# Altium schematic sheet RV1126_OSC-PLL-PMUIO.SchDoc
size A4; SheetNumber: 16; SheetTotal: 28
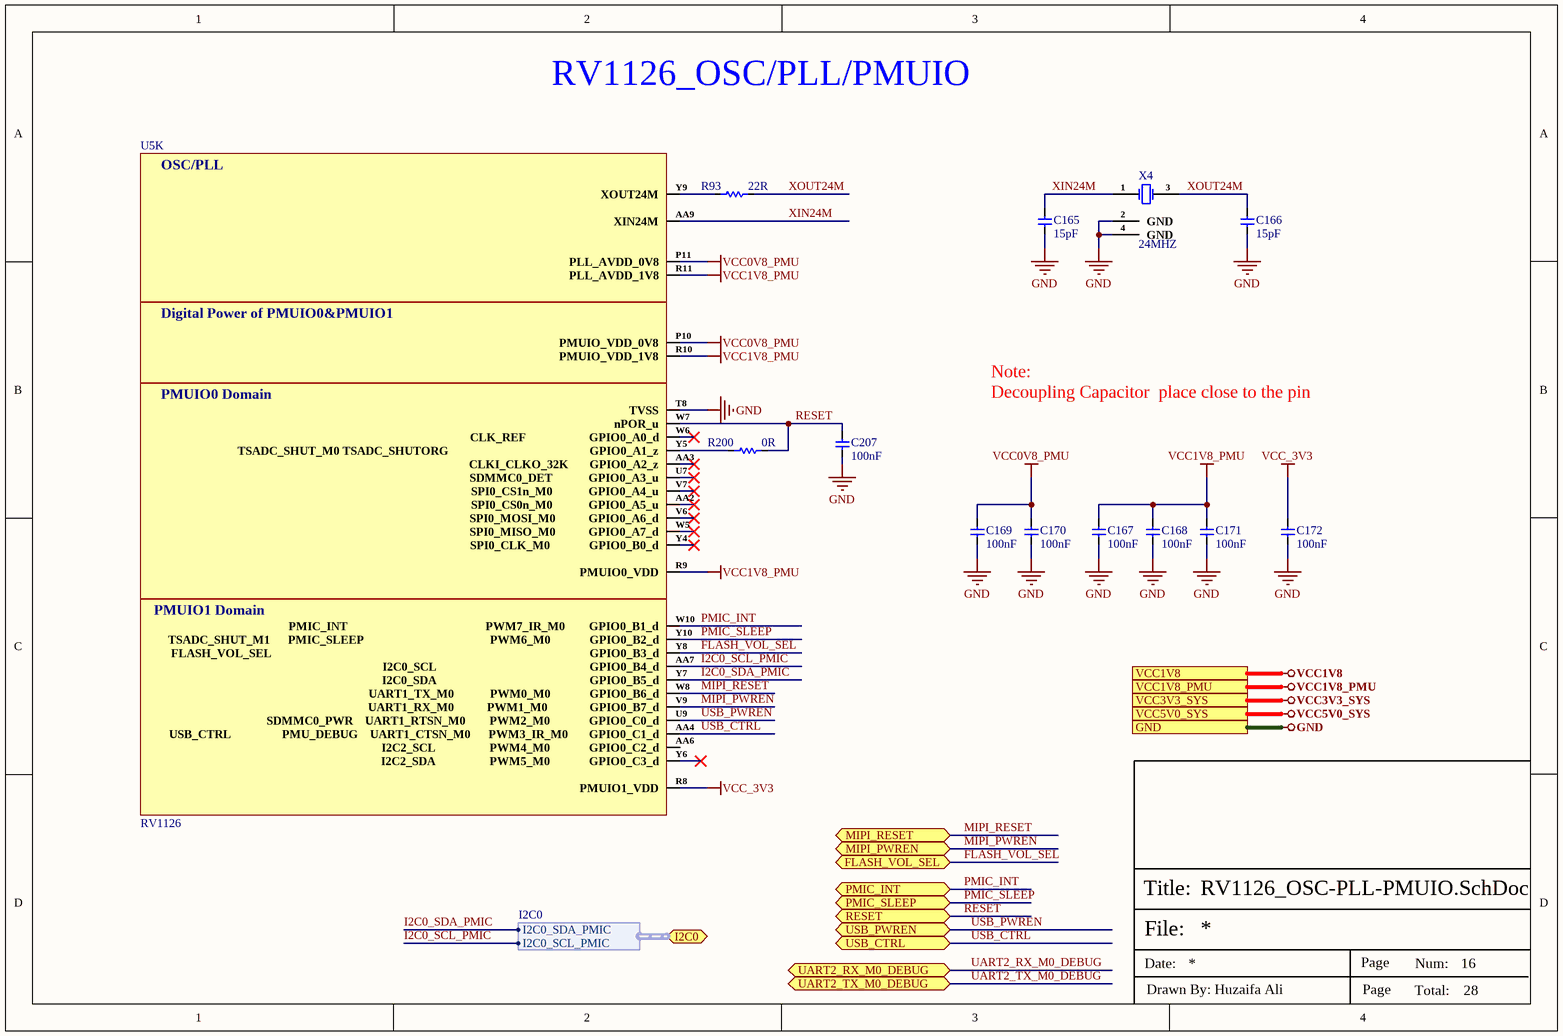
[diagram p0: RV1126_OSC-PLL-PMUIO.SchDoc]

## Parts
C165  15pF  [Cap-0201]
C166  15pF  [Cap-0201]
C167  100nF  [CAP-0201]
C168  100nF  [CAP-0201]
C169  100nF  [CAP-0201]
C170  100nF  [CAP-0201]
C171  100nF  [CAP-0201]
C172  100nF  [CAP-0201]
C207  100nF  [CAP-0201]
R93  22R  [Res-0402]
R200  0R  [Res-0402]
U5  RV1126  [FCCSP-409(14x14)]  (part K of 15)
X4  24MHZ  [X322524MOB4SI-]

## Ports
FLASH_VOL_SEL (bidir, see RV1126_eMMC_SPI-FLASH[3B]), GND (see BUCK_CONTROLLER_SHEET2[3D], BUCK_CONVERTER_SHEET1[3D], DDR3_SDRAM_SHEET[5D], DEBUG_UART_INTERFACE[3D], DIGITAL_MEMS_INTERFACE[3C], eMMC_INTERFACE[3D], ETH_PoE-PD_INTERFACE[4D], ETH_SWITCH_INTERFACE[5D], IR-CUT_LIGHT SENSOR_SHEET[3D], MIPI TO HDMI_MODULE[3D], MIPI-CSI_RXX_INTERFACE[3C], PoE_PSE_CONTROLLER[5D], POWER_LDO_SHEET[3D], POWER_PMIC_RK809_CODEC[3C], POWER_PMIC_RK809_DC DC[3D], POWER_PMIC_RK809_LDO[4C], POWER_PMIC_RK809_MGM[3D], RV1126_AUDIO_SHEET[3D], RV1126_DRAM_SHEET[4C], RV1126_eMMC_SPI-FLASH[3C], RV1126_ETHERNET_SHEET[3D], RV1126_POWER_SHEET[1D], RV1126_SARADC_SHEET[3C], RV1126_SDMMC_SHEET[3C], SPEARKER_INTERFACE_SHEET[3C], SPI_FLASH_INTERFACE[3D], USB2.0_DEBUG_UART[3D]), I2C0 (bidir, harness I2C0, see POWER_PMIC_RK809_MGM[2D]), MIPI_PWREN (bidir, see MIPI TO HDMI_MODULE[3D]), MIPI_RESET (bidir, see MIPI TO HDMI_MODULE[3D]), PMIC_INT (bidir, see POWER_PMIC_RK809_MGM[1D]), PMIC_SLEEP (bidir, see POWER_PMIC_RK809_MGM[1D]), RESET (bidir, see POWER_PMIC_RK809_MGM[1D]), UART2_RX_M0_DEBUG (bidir, see DEBUG_UART_INTERFACE[2D], RV1126_SARADC_SHEET[2D]), UART2_TX_M0_DEBUG (bidir, see DEBUG_UART_INTERFACE[2D], RV1126_SARADC_SHEET[2D]), USB_CTRL (bidir, see USB2.0_DEBUG_UART[2D]), USB_PWREN (bidir, see USB2.0_DEBUG_UART[2D]), VCC1V8 (see DIGITAL_MEMS_INTERFACE[3C], IR-CUT_LIGHT SENSOR_SHEET[3D], MIPI TO HDMI_MODULE[3D], MIPI-CSI_RXX_INTERFACE[3C], POWER_PMIC_RK809_LDO[4C], POWER_PMIC_RK809_MGM[3D], RV1126_AUDIO_SHEET[3D], RV1126_eMMC_SPI-FLASH[3C], RV1126_ETHERNET_SHEET[3D], RV1126_SARADC_SHEET[3C], RV1126_SDMMC_SHEET[3C], USB2.0_DEBUG_UART[3D]), VCC1V8_PMU (see POWER_PMIC_RK809_LDO[4C], POWER_PMIC_RK809_MGM[3D]), VCC3V3_SYS (see MIPI TO HDMI_MODULE[3D], POWER_PMIC_RK809_DC DC[3D], POWER_PMIC_RK809_LDO[4C], POWER_PMIC_RK809_MGM[3D]), VCC5V0_SYS (see BUCK_CONVERTER_SHEET1[3D], IR-CUT_LIGHT SENSOR_SHEET[3D], MIPI TO HDMI_MODULE[3D], POWER_LDO_SHEET[3D], POWER_PMIC_RK809_CODEC[3C], POWER_PMIC_RK809_DC DC[3D], POWER_PMIC_RK809_LDO[4C], POWER_PMIC_RK809_MGM[3D], USB2.0_DEBUG_UART[3D])

## Harnesses
I2C0: I2C0_SDA_PMIC, I2C0_SCL_PMIC

## Nets
GND: C165.1 C166.1 C167.1 C168.1 C169.1 C170.1 C171.1 C172.1 C207.1 U5.T8(TVSS) X4.2(GND) X4.4(GND) ; port GND
VCC0V8_PMU: C169.2 C170.2 U5.P10(PMUIO_VDD_0V8) U5.P11(PLL_AVDD_0V8)
VCC1V8: port VCC1V8
VCC1V8_PMU: C167.2 C168.2 C171.2 U5.R9(PMUIO0_VDD) U5.R10(PMUIO_VDD_1V8) U5.R11(PLL_AVDD_1V8) ; port VCC1V8_PMU
VCC3V3_SYS: port VCC3V3_SYS
VCC5V0_SYS: port VCC5V0_SYS
VCC_3V3: C172.2 U5.R8(PMUIO1_VDD)
FLASH_VOL_SEL: U5.Y8(FLASH_VOL_SEL__________________________________________________________________________________________________________GPIO0_B3_d) ; port FLASH_VOL_SEL
I2C0_SCL_PMIC: U5.AA7(I2C0_SCL___________________________________________________GPIO0_B4_d) ; port I2C0.I2C0_SCL_PMIC
I2C0_SDA_PMIC: U5.Y7(I2C0_SDA___________________________________________________GPIO0_B5_d) ; port I2C0.I2C0_SDA_PMIC
MIPI_PWREN: U5.V9(UART1_RX_M0___________PWM1_M0______________GPIO0_B7_d) ; port MIPI_PWREN
MIPI_RESET: U5.W8(UART1_TX_M0____________PWM0_M0_____________GPIO0_B6_d) ; port MIPI_RESET
PMIC_INT: U5.W10(PMIC_INT______________________________________________PWM7_IR_M0________GPIO0_B1_d) ; port PMIC_INT
PMIC_SLEEP: U5.Y10(TSADC_SHUT_M1______PMIC_SLEEP__________________________________________PWM6_M0_____________GPIO0_B2_d) ; port PMIC_SLEEP
RESET: C207.2 R200.2 U5.W7(nPOR_u) ; port RESET
UART2_RX_M0_DEBUG: port UART2_RX_M0_DEBUG
UART2_TX_M0_DEBUG: port UART2_TX_M0_DEBUG
USB_CTRL: U5.AA4(USB_CTRL_________________PMU_DEBUG____UART1_CTSN_M0______PWM3_IR_M0_______GPIO0_C1_d) ; port USB_CTRL
USB_PWREN: U5.U9(SDMMC0_PWR____UART1_RTSN_M0________PWM2_M0_____________GPIO0_C0_d) ; port USB_PWREN
XIN24M: C165.2 U5.AA9(XIN24M) X4.1(CRYSTAL)
XOUT24M: C166.2 R93.2 X4.3(CRYSTAL)
NetR93_1: R93.1 U5.Y9(XOUT24M)
NetR200_1: R200.1 U5.Y5(TSADC_SHUT_M0_TSADC_SHUTORG_______________________________________________GPIO0_A1_z)

Not connected (* = marked no-connect by the designer): U5 AA2(SPI0_CS0n_M0____________GPIO0_A5_u)* AA3(CLKI_CLKO_32K_______GPIO0_A2_z)* AA6(I2C2_SCL__________________PWM4_M0_____________GPIO0_C2_d) U7(SDMMC0_DET____________GPIO0_A3_u)* V6(SPI0_MOSI_M0___________GPIO0_A6_d)* V7(SPI0_CS1n_M0____________GPIO0_A4_u)* W5(SPI0_MISO_M0___________GPIO0_A7_d)* W6(CLK_REF_____________________GPIO0_A0_d)* Y4(SPI0_CLK_M0_____________GPIO0_B0_d)* Y6(I2C2_SDA__________________PWM5_M0_____________GPIO0_C3_d)*

## Notes on the sheet
- RV1126_OSC/PLL/PMUIO
- Note:
- Decoupling Capacitor  place close to the pin
- File:
- Title:
- Date:
- Page
- Num:
- Total:
- Drawn By: Huzaifa Ali
- (in symbol RV1126, part K) OSC/PLL; Digital Power of PMUIO0&PMUIO1; PMUIO0 Domain; PMUIO1 Domain

## Library data of the parts
C165 C166 = CC0201JRNPO9BN150: CAP CER 15PF 50V C0G/NPO 0201; Manufacturer: Yageo; Item Type: Capacitor; Supplier: Future Electronics; Supplier Part Number: 2580314; Manufacturer Part Number: CC0201JRNPO9BN150; RoHS: Yes; Category: Ceramic Capacitors; Stock: 585000; Pricing: 15000=0.0012, 60000=0.0011, 225000=0.0011, 600000=0.001, 1500000=0.001 (USD); ComponentLink1URL: https://datasheet.ciiva.com/176/mlccorderingcode-176501.pdf?src-supplier=Digi-Key; ComponentLink1Description: https://datasheet.ciiva.com/176/mlccorderingcode-176501.pdf?src-supplier=Digi-Key; ComponentLink2URL: https://datasheet.ciiva.com/176/mlccorderingcode-176502.pdf?src-supplier=Digi-Key; ComponentLink2Description: https://datasheet.ciiva.com/176/mlccorderingcode-176502.pdf?src-supplier=Digi-Key; ComponentLink3URL: https://datasheet.ciiva.com/176/mlccorderingcode-176503.pdf?src-supplier=Digi-Key; ComponentLink3Description: https://datasheet.ciiva.com/176/mlccorderingcode-176503.pdf?src-supplier=Digi-Key; ComponentLink4URL: https://datasheet.ciiva.com/17205/upy-gp-np0-16v-to-50v-8-17205625.pdf?src-supplier=Future+Electronics; ComponentLink4Description: https://datasheet.ciiva.com/17205/upy-gp-np0-16v-to-50v-8-17205625.pdf?src-supplier=Future+Electronics; LCSC Part Number: C277480
C167-C172 C207 = CC0201KRX5R6BB104: CAP CER 0.1UF 10V X5R 0201; Manufacturer: Yageo; Tolerance: 10%; Supplier 1: Mouser; Manufacturer Part Number: CC0201KRX5R6BB104; RoHS: Yes; Category: Ceramic Capacitors; Stock 1: 824403; Pricing 1: 1=0.10000, 10=0.02400, 50=0.02400, 100=0.01900, 1000=0.01100, 10000=0.00900 (USD); Mount: Surface Mount; Case/Package: 0201; Case Code (Imperial): 0201; Case Code (Metric): 0603; Weight: 6E-06oz; Min Operating Temperature: -55°C; Max Operating Temperature: 85°C; Capacitance: 100nF; Dielectric: X5R; Voltage Rating (DC): 10V; Packaging: Tape and Reel; Termination: SMD/SMT; Resistor Type: Ceramic; Voltage Rating: 10V; Series: CC; Construction: Flat; Length: 0.6mm; Width: 0.012inch; Height: 0.3mm; Thickness: 0.013inch; Depth: 0.3mm; Radiation Hardening: No; Lead Free: Lead Free; Halogen Free: Halogen Free; RoHS Compliant: Yes; ComponentLink1URL: https://datasheet.ciiva.com/11587/upy-gphc-x5r-4v-to-50v-12-11587190.pdf?src-supplier=Avnet; ComponentLink1Description: https://datasheet.ciiva.com/11587/upy-gphc-x5r-4v-to-50v-12-11587190.pdf?src-supplier=Avnet; Supplier Part Number 1: 603-CC201KRX5R6BB104; LCSC Part Number: C190183
R93 = RC0402FR-0722RL: RES 22 OHM 1% 1/16W 0402; Manufacturer: Yageo; Voltage Rating: 50V; Power Rating: 62.5mW; Temperature Coefficient: 100ppm/°C; Max Power Dissipation: 63mW; Item Type: Resistor; Supplier 1: Avnet; Manufacturer Part Number: RC0402FR-0722RL; RoHS: Yes; Category: Chip SMD Resistors; Stock 1: 1810000; Pricing 1: 10000=0.00085 (USD); Case/Package: 0402; Number of Pins: 2; Case Code (Imperial): 0402; Case Code (Metric): 1005; Size Code: 0402; Min Operating Temperature: -55°C; Max Operating Temperature: 155°C; Resistor Type: Thick Film; Voltage Rating (DC): 50V; Resistance: 22R; Tolerance: 1%; Packaging: Tape and Reel; Termination: SMD/SMT; Features: Moisture Resistant; Series: RC; Number of Terminations: 2; Resistance Tolerance: 1%; Technology: THICK FILM; Construction: Rectangular; Length: 1mm; Width: 0.5mm; Height: 0.32mm; Depth: 0.5mm; RoHS Compliant: Yes; Reach SVHC Compliant: Yes; Military Standard: Not; Lead Free: Lead Free; ComponentLink1URL: https://datasheet.ciiva.com/11819/0900766b80c66297-11819462.pdf?src-supplier=RSComponents; ComponentLink1Description: https://datasheet.ciiva.com/11819/0900766b80c66297-11819462.pdf?src-supplier=RSComponents; ComponentLink2URL: https://datasheet.ciiva.com/7849/1018594-7849912.pdf?src-supplier=Element14; ComponentLink2Description: https://datasheet.ciiva.com/7849/1018594-7849912.pdf?src-supplier=Element14; ComponentLink3URL: https://datasheet.ciiva.com/7849/1018594-7849911.pdf?src-supplier=Element14; ComponentLink3Description: https://datasheet.ciiva.com/7849/1018594-7849911.pdf?src-supplier=Element14; ComponentLink4URL: https://datasheet.ciiva.com/16930/pyu-rc0402-51-rohs-l-6-r-16930687.pdf?src-supplier=Future+Electronics; ComponentLink4Description: https://datasheet.ciiva.com/16930/pyu-rc0402-51-rohs-l-6-r-16930687.pdf?src-supplier=Future+Electronics; ComponentLink5URL: https://datasheet.ciiva.com/26829/getdatasheetpartid-554995-26829991.pdf?src-supplier=Verical; ComponentLink5Description: https://datasheet.ciiva.com/26829/getdatasheetpartid-554995-26829991.pdf?src-supplier=Verical; Supplier Part Number 1: RC0402FR-0722RL; LCSC Part Number: C114765
R200 = RC0402FR-070RL: RES 0 OHM JUMPER 1/16W 0402; Manufacturer: Yageo; Item Type: Resistors; Tolerance: 1%; Power Rating: 62.5mW; Voltage Rating: 50V; Temperature Coefficient: 200ppm/°C; Max Power Dissipation: 63mW; Supplier 1: Mouser; Manufacturer Part Number: RC0402FR-070RL; RoHS: Yes; Stock 1: 8556842; Pricing 1: 1=0.10000, 10=0.01400, 50=0.01400, 100=0.00600, 1000=0.00300, 5000=0.00200, 10000=0.00100 (USD); Mount: Surface Mount; Case/Package: 0402; Contact Plating: Tin,Matte; Case Code (Imperial): 0402; Case Code (Metric): 1005; Size Code: 0402; Min Operating Temperature: -55°C; Max Operating Temperature: 155°C; Resistance: 0R; Resistor Type: Thick Film; Packaging: Tape and Reel; Termination: SMD/SMT; Features: Moisture Resistant; Series: RC; Number of Terminations: 2; Length: 1mm; Width: 0.5mm; Height: 0.35mm; Radiation Hardening: No; Lead Free: Lead Free; RoHS Compliant: Yes; ComponentLink1URL: https://datasheet.ciiva.com/8896/pyu-rc0402-51-rohs-l-6-8896149.pdf?src-supplier=Avnet; ComponentLink1Description: https://datasheet.ciiva.com/8896/pyu-rc0402-51-rohs-l-6-8896149.pdf?src-supplier=Avnet; ComponentLink2URL: https://datasheet.ciiva.com/16790/pyu-rc0402-51-rohs-l-6-r-16790444.pdf?src-supplier=Future+Electronics; ComponentLink2Description: https://datasheet.ciiva.com/16790/pyu-rc0402-51-rohs-l-6-r-16790444.pdf?src-supplier=Future+Electronics; Supplier Part Number 1: 603-RC0402FR-070RL; LCSC Part Number: C106231
U5 = RV1126: FCCSP-409(14x14) Microcontroller Units (MCUs/MPUs/SOCs) ROHS; Manufacturer: Rockchip; Manufacturer Part Number: RV1126; Package: FCCSP-409(14x14); LCSC Part Number: C2859017; Item Type: Microcontroller; ComponentLink1Description: LCSC; ComponentLink1URL: https://www.lcsc.com/product-detail/Microcontroller-Units-MCUs-MPUs-SOCs_Rockchip-RV1126_C2859017.html
X4 = X322524MOB4SI: 24MHz SMD Crystal Resonator 12pF ±10ppm ±30ppm -40℃~+85℃ SMD3225-4P Crystals ROHS; Manufacturer: Yangxing Tech; ComponentLink1Description: LCSC; ComponentLink1URL: https://www.lcsc.com/product-detail/Crystals_Yangxing-Tech-X322524MOB4SI_C70590.html; Manufacturer Part Number: X322524MOB4SI; Footprint: Custom; LCSC Part Number: C70590; Item Type: Crystal